# Altium schematic sheet GND_Sheet.SchDoc
size A4; DocumentNumber: 8; SheetNumber: 8; SheetTotal: 27
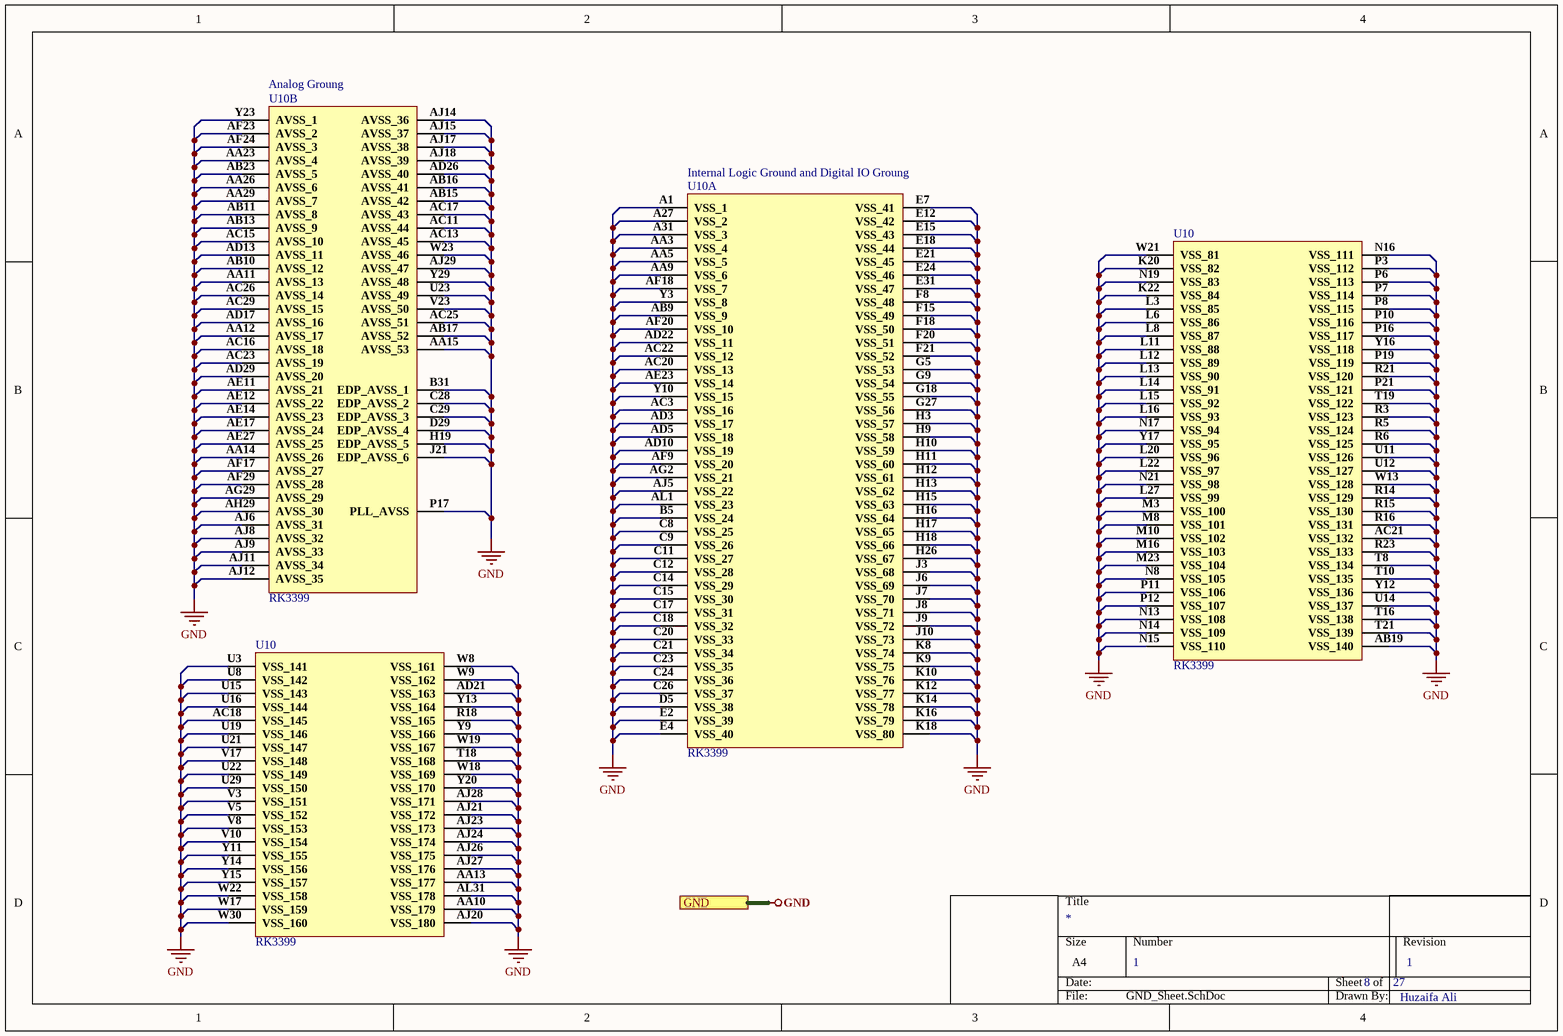
[diagram p0: GND_Sheet.SchDoc]

## Parts
U10  RK3399  [RK3399]  (parts A,B,33,34 of 34)

## Ports
GND

## Nets
GND: U10.A1(VSS_1) U10.A27(VSS_2) U10.A31(VSS_3) U10.AA3(VSS_4) U10.AA5(VSS_5) U10.AA9(VSS_6) U10.AA10(VSS_179) U10.AA11(AVSS_13) U10.AA12(AVSS_17) U10.AA13(VSS_177) U10.AA14(AVSS_26) U10.AA15(AVSS_53) U10.AA23(AVSS_4) U10.AA26(AVSS_6) U10.AA29(AVSS_7) U10.AB9(VSS_9) U10.AB10(AVSS_12) U10.AB11(AVSS_8) U10.AB13(AVSS_9) U10.AB15(AVSS_42) U10.AB16(AVSS_41) U10.AB17(AVSS_52) U10.AB19(VSS_140) U10.AB23(AVSS_5) U10.AC3(VSS_16) U10.AC11(AVSS_44) U10.AC13(AVSS_45) U10.AC15(AVSS_10) U10.AC16(AVSS_18) U10.AC17(AVSS_43) U10.AC18(VSS_145) U10.AC20(VSS_13) U10.AC21(VSS_132) U10.AC22(VSS_12) U10.AC23(AVSS_19) U10.AC25(AVSS_51) U10.AC26(AVSS_14) U10.AC29(AVSS_15) U10.AD3(VSS_17) U10.AD5(VSS_18) U10.AD10(VSS_19) U10.AD13(AVSS_11) U10.AD17(AVSS_16) U10.AD21(VSS_163) U10.AD22(VSS_11) U10.AD26(AVSS_40) U10.AD29(AVSS_20) U10.AE11(AVSS_21) U10.AE12(AVSS_22) U10.AE14(AVSS_23) U10.AE17(AVSS_24) U10.AE23(VSS_14) U10.AE27(AVSS_25) U10.AF9(VSS_20) U10.AF17(AVSS_27) U10.AF18(VSS_7) U10.AF20(VSS_10) U10.AF23(AVSS_2) U10.AF24(AVSS_3) U10.AF29(AVSS_28) U10.AG2(VSS_21) U10.AG29(AVSS_29) U10.AH29(AVSS_30) U10.AJ5(VSS_22) U10.AJ6(AVSS_31) U10.AJ8(AVSS_32) U10.AJ9(AVSS_33) U10.AJ11(AVSS_34) U10.AJ12(AVSS_35) U10.AJ14(AVSS_36) U10.AJ15(AVSS_37) U10.AJ17(AVSS_38) U10.AJ18(AVSS_39) U10.AJ20(VSS_180) U10.AJ21(VSS_172) U10.AJ23(VSS_173) U10.AJ24(VSS_174) U10.AJ26(VSS_175) U10.AJ27(VSS_176) U10.AJ28(VSS_171) U10.AJ29(AVSS_47) U10.AL1(VSS_23) U10.AL31(VSS_178) U10.B5(VSS_24) U10.B31(EDP_AVSS_1) U10.C8(VSS_25) U10.C9(VSS_26) U10.C11(VSS_27) U10.C12(VSS_28) U10.C14(VSS_29) U10.C15(VSS_30) U10.C17(VSS_31) U10.C18(VSS_32) U10.C20(VSS_33) U10.C21(VSS_34) U10.C23(VSS_35) U10.C24(VSS_36) U10.C26(VSS_37) U10.C28(EDP_AVSS_2) U10.C29(EDP_AVSS_3) U10.D5(VSS_38) U10.D29(EDP_AVSS_4) U10.E2(VSS_39) U10.E4(VSS_40) U10.E7(VSS_41) U10.E12(VSS_42) U10.E15(VSS_43) U10.E18(VSS_44) U10.E21(VSS_45) U10.E24(VSS_46) U10.E31(VSS_47) U10.F8(VSS_48) U10.F15(VSS_49) U10.F18(VSS_50) U10.F20(VSS_51) U10.F21(VSS_52) U10.G5(VSS_53) U10.G9(VSS_54) U10.G18(VSS_55) U10.G27(VSS_56) U10.H3(VSS_57) U10.H9(VSS_58) U10.H10(VSS_59) U10.H11(VSS_60) U10.H12(VSS_61) U10.H13(VSS_62) U10.H15(VSS_63) U10.H16(VSS_64) U10.H17(VSS_65) U10.H18(VSS_66) U10.H19(EDP_AVSS_5) U10.H26(VSS_67) U10.J3(VSS_68) U10.J6(VSS_69) U10.J7(VSS_70) U10.J8(VSS_71) U10.J9(VSS_72) U10.J10(VSS_73) U10.J21(EDP_AVSS_6) U10.K8(VSS_74) U10.K9(VSS_75) U10.K10(VSS_76) U10.K12(VSS_77) U10.K14(VSS_78) U10.K16(VSS_79) U10.K18(VSS_80) U10.K20(VSS_82) U10.K22(VSS_84) U10.L3(VSS_85) U10.L6(VSS_86) U10.L8(VSS_87) U10.L11(VSS_88) U10.L12(VSS_89) U10.L13(VSS_90) U10.L14(VSS_91) U10.L15(VSS_92) U10.L16(VSS_93) U10.L20(VSS_96) U10.L22(VSS_97) U10.L27(VSS_99) U10.M3(VSS_100) U10.M8(VSS_101) U10.M10(VSS_102) U10.M16(VSS_103) U10.M23(VSS_104) U10.N8(VSS_105) U10.N13(VSS_108) U10.N14(VSS_109) U10.N15(VSS_110) U10.N16(VSS_111) U10.N17(VSS_94) U10.N19(VSS_83) U10.N21(VSS_98) U10.P3(VSS_112) U10.P6(VSS_113) U10.P7(VSS_114) U10.P8(VSS_115) U10.P10(VSS_116) U10.P11(VSS_106) U10.P12(VSS_107) U10.P16(VSS_117) U10.P17(PLL_AVSS) U10.P19(VSS_119) U10.P21(VSS_121) U10.R3(VSS_123) U10.R5(VSS_124) U10.R6(VSS_125) U10.R14(VSS_129) U10.R15(VSS_130) U10.R16(VSS_131) U10.R18(VSS_165) U10.R21(VSS_120) U10.R23(VSS_133) U10.T8(VSS_134) U10.T10(VSS_135) U10.T16(VSS_138) U10.T18(VSS_168) U10.T19(VSS_122) U10.T21(VSS_139) U10.U3(VSS_141) U10.U8(VSS_142) U10.U11(VSS_126) U10.U12(VSS_127) U10.U14(VSS_137) U10.U15(VSS_143) U10.U16(VSS_144) U10.U19(VSS_146) U10.U21(VSS_147) U10.U22(VSS_149) U10.U23(AVSS_49) U10.U29(VSS_150) U10.V3(VSS_151) U10.V5(VSS_152) U10.V8(VSS_153) U10.V10(VSS_154) U10.V17(VSS_148) U10.V23(AVSS_50) U10.W8(VSS_161) U10.W9(VSS_162) U10.W13(VSS_128) U10.W17(VSS_159) U10.W18(VSS_169) U10.W19(VSS_167) U10.W21(VSS_81) U10.W22(VSS_158) U10.W23(AVSS_46) U10.W30(VSS_160) U10.Y3(VSS_8) U10.Y9(VSS_166) U10.Y10(VSS_15) U10.Y11(VSS_155) U10.Y12(VSS_136) U10.Y13(VSS_164) U10.Y14(VSS_156) U10.Y15(VSS_157) U10.Y16(VSS_118) U10.Y17(VSS_95) U10.Y20(VSS_170) U10.Y23(AVSS_1) U10.Y29(AVSS_48) ; port GND

## Notes on the sheet
- 1
- Huzaifa Ali
- (in symbol RK3399, part A) Internal Logic Ground and Digital IO Groung
- (in symbol RK3399, part B) Analog Groung

## Library data of the parts
U10 = RK3399: RK3399 CPU BGA for HD set-top box chip BGA Chipse; Manufacturer: Fuzhou Rockchip Electronics; ComponentLink1Description: Aliexpress; ComponentLink1URL: https://www.aliexpress.com/item/1005001971093459.html?spm=a2g0n.productlist.0.0.3c7csv8Qsv8Quh&browser_id=3ac7e9efb8074641aaabc4d871f09748&aff_trace_key=&aff_platform=msite&m_page_id=181389a08711fc2600d8cc522bab8d702dd4189be0&gclid=&pdp_npi=2%40dis%21USD%21%2123.6%21%21%21%21%21%402101d91e16545120399167831e8b89%21%21sea&algo_pvid=4303aedd-774c-4013-953d-920f10b55003; Manufacturer Part Number: RK3399; Footprint: FCBGA828